# Altium project George Task.PrjPcb
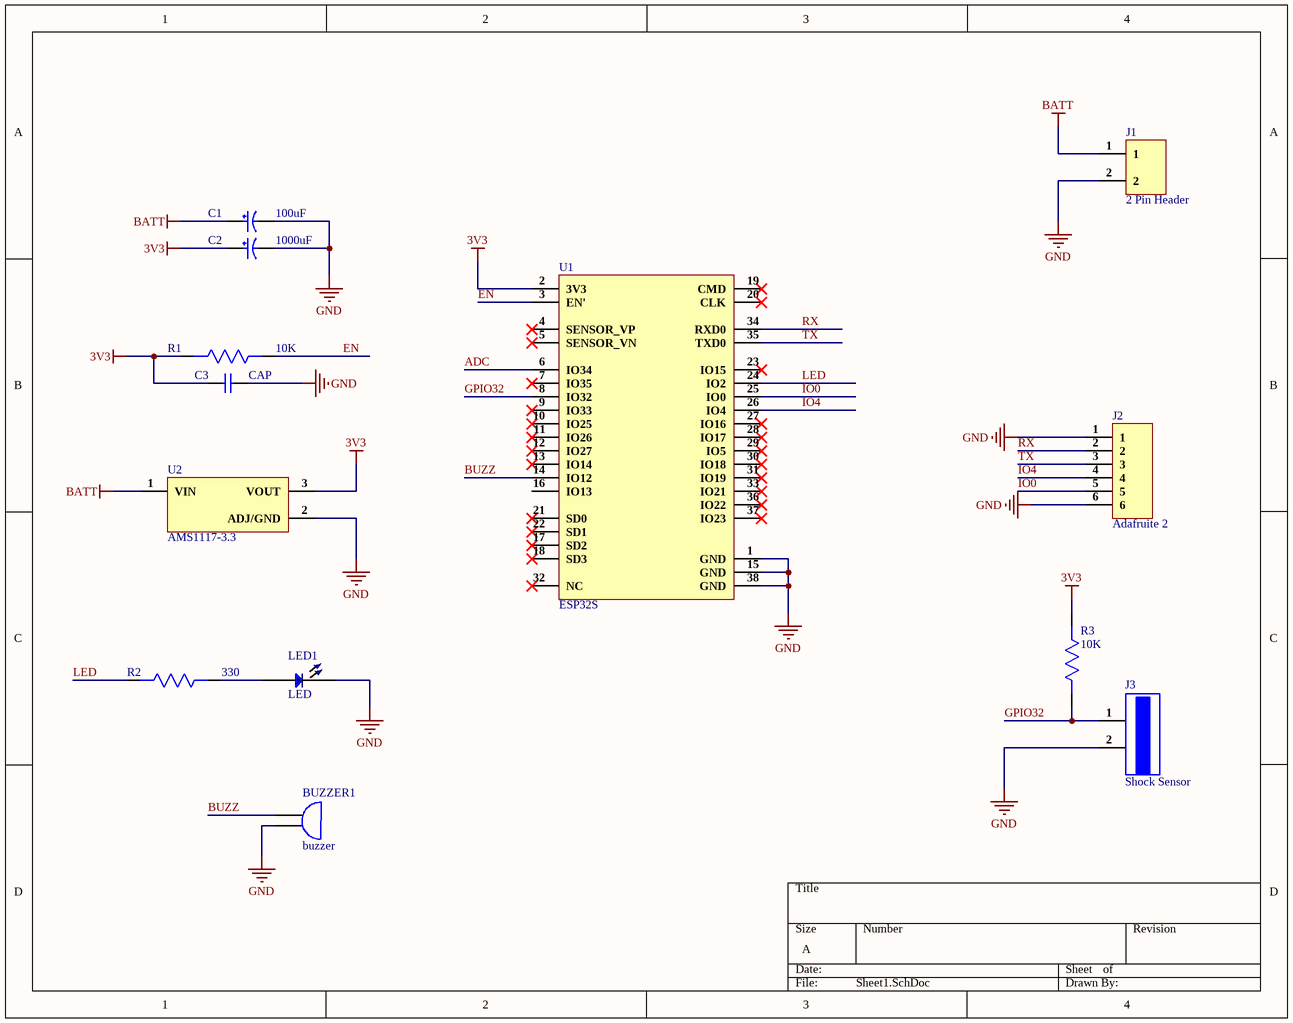
[diagram p0: Sheet1.SchDoc]
1 sheet, 13 parts. Net scope: global (net labels, ports and power ports of the same name join across sheets).

## Sheet Sheet1.SchDoc
size A

### Parts
BUZZER1  buzzer
C1  100uF
C2  1000uF
C3  CAP
J1  2 Pin Header
J2  Adafruite 2
J3  Shock Sensor
LED1  LED
R1  10K
R2  330
R3  10K
U1  ESP32S
U2  AMS1117-3.3

### Nets
3V3: C2.2 C3.1 R1.2 R3.1 U1.2(3V3) U2.3(VOUT)
BATT: C1.2 J1.1 U2.1(VIN)
GND: BUZZER1.2 C1.1 C2.1 C3.2 J1.2 J2.1 J2.6 J3.2 LED1.K U1.1(GND) U1.15(GND) U1.38(GND) U2.2(ADJ/GND)
ADC: U1.6(IO34)
BUZZ: BUZZER1.1 U1.14(IO12)
EN: R1.1 U1.3(EN')
GPIO32: J3.1 R3.2 U1.8(IO32)
IO0: J2.5 U1.25(IO0)
IO4: J2.4 U1.26(IO4)
LED: R2.2 U1.24(IO2)
RX: J2.2 U1.34(RXD0)
TX: J2.3 U1.35(TXD0)
NetLED1_A: LED1.A R2.1

Not connected (* = marked no-connect by the designer): U1 4(SENSOR_VP)* 5(SENSOR_VN)* 7(IO35)* 9(IO33)* 10(IO25)* 11(IO26)* 12(IO27)* 13(IO14)* 16(IO13) 17(SD2)* 18(SD3)* 19(CMD)* 20(CLK)* 21(SD0)* 22(SD1)* 23(IO15)* 27(IO16)* 28(IO17)* 29(IO5)* 30(IO18)* 31(IO19)* 32(NC)* 33(IO21)* 36(IO22)* 37(IO23)*

### Library data of the parts
C1 C2 = CAP TANT
C3 = CAP CER
J2 = Adafruite 2135
R1-R3 = resistor